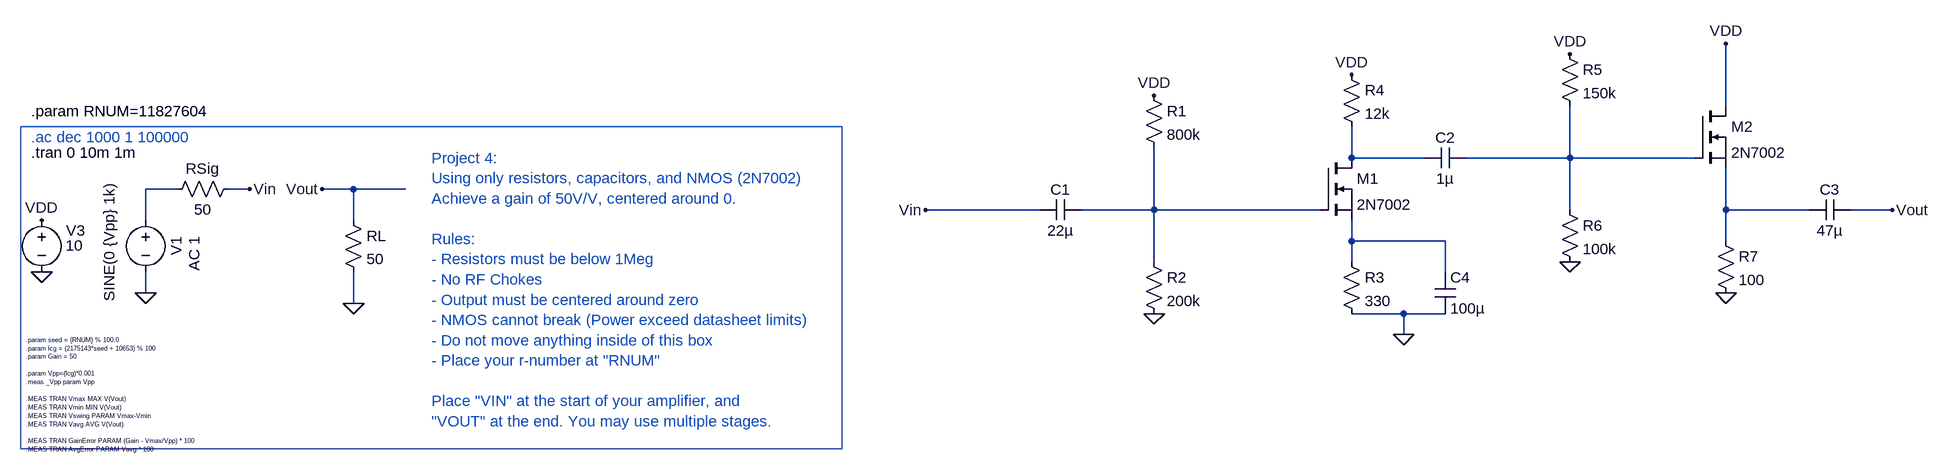
[diagram p0: schematic Project 4.asc]
Project 4.asc, the LTspice schematic file:
Version 4.1
SHEET 1 3156 680
WIRE 2048 16 2048 -80
WIRE 1472 96 1472 48
WIRE 1584 96 1472 96
WIRE 1808 96 1808 16
WIRE 1808 96 1648 96
WIRE 2000 96 1808 96
WIRE -336 144 -384 144
WIRE -224 144 -256 144
WIRE -64 144 -112 144
WIRE 16 144 -64 144
WIRE 992 176 816 176
WIRE 1168 176 1168 80
WIRE 1168 176 1056 176
WIRE 1424 176 1168 176
WIRE 1808 176 1808 96
WIRE 2048 176 2048 112
WIRE 2176 176 2048 176
WIRE 2304 176 2240 176
WIRE -384 192 -384 144
WIRE -64 192 -64 144
WIRE 1472 224 1472 192
WIRE 1616 224 1472 224
WIRE 2048 224 2048 176
WIRE 1168 256 1168 176
WIRE 1472 256 1472 224
WIRE 1616 272 1616 224
WIRE -384 304 -384 272
WIRE -64 320 -64 272
WIRE 1552 336 1472 336
WIRE 1616 336 1552 336
WIRE 1552 368 1552 336
FLAG -384 304 0
FLAG -64 320 0
FLAG -544 272 0
FLAG -544 192 VDD
FLAG -224 144 Vin
FLAG -112 144 Vout
FLAG 816 176 Vin
FLAG 1168 0 VDD
FLAG 1168 336 0
FLAG 1472 -32 VDD
FLAG 1808 256 0
FLAG 2048 304 0
FLAG 1808 -64 VDD
FLAG 2048 -80 VDD
FLAG 2304 176 Vout
FLAG 1552 368 0
SYMBOL voltage -384 176 R0
WINDOW 3 -56 -42 VRight 2
WINDOW 123 75 41 VRight 2
WINDOW 39 0 0 Left 0
WINDOW 0 47 41 VRight 2
SYMATTR Value SINE(0 {Vpp} 1k)
SYMATTR Value2 AC 1
SYMATTR InstName V1
SYMBOL res -80 176 R0
SYMATTR InstName RL
SYMATTR Value 50
SYMBOL res -240 128 R90
WINDOW 0 0 56 VBottom 2
WINDOW 3 32 56 VTop 2
SYMATTR InstName RSig
SYMATTR Value 50
SYMBOL voltage -544 176 R0
WINDOW 3 37 55 Left 2
WINDOW 123 0 0 Left 0
WINDOW 39 0 0 Left 0
WINDOW 0 38 32 Left 2
SYMATTR Value 10
SYMATTR InstName V3
SYMBOL cap 1056 160 R90
WINDOW 0 0 32 VBottom 2
WINDOW 3 32 32 VTop 2
SYMATTR InstName C1
SYMATTR Value 22µ
SYMBOL res 1152 -16 R0
SYMATTR InstName R1
SYMATTR Value 800k
SYMBOL res 1152 240 R0
SYMATTR InstName R2
SYMATTR Value 200k
SYMBOL res 1456 -48 R0
SYMATTR InstName R4
SYMATTR Value 12k
SYMBOL cap 1648 80 R90
WINDOW 0 0 32 VBottom 2
WINDOW 3 32 32 VTop 2
SYMATTR InstName C2
SYMATTR Value 1µ
SYMBOL res 1792 -80 R0
SYMATTR InstName R5
SYMATTR Value 150k
SYMBOL res 1792 160 R0
SYMATTR InstName R6
SYMATTR Value 100k
SYMBOL res 2032 208 R0
SYMATTR InstName R7
SYMATTR Value 100
SYMBOL cap 2240 160 R90
WINDOW 0 0 32 VBottom 2
WINDOW 3 32 32 VTop 2
SYMATTR InstName C3
SYMATTR Value 47µ
SYMBOL res 1456 240 R0
SYMATTR InstName R3
SYMATTR Value 330
SYMBOL nmos 1424 96 R0
SYMATTR InstName M1
SYMATTR Value 2N7002
SYMBOL nmos 2000 16 R0
SYMATTR InstName M2
SYMATTR Value 2N7002
SYMBOL cap 1600 272 R0
SYMATTR InstName C4
SYMATTR Value 100µ
TEXT -560 88 Left 2 !.tran 0 10m 1m
TEXT -560 64 Left 2 ;.ac dec 1000 1 100000
TEXT -560 24 Left 2 !.param RNUM=11827604
TEXT -568 376 Left 0 !.param seed = {RNUM} % 100.0\n.param lcg = (2175143*seed + 10653) % 100\n.param Gain = 50\n \n.param Vpp=(lcg)*0.001\n.meas _Vpp param Vpp\n \n.MEAS TRAN Vmax MAX V(Vout)\n.MEAS TRAN Vmin MIN V(Vout)\n.MEAS TRAN Vswing PARAM Vmax-Vmin\n.MEAS TRAN Vavg AVG V(Vout)\n \n.MEAS TRAN GainError PARAM (Gain - Vmax/Vpp) * 100\n.MEAS TRAN AvgError PARAM Vavg * 100
TEXT 56 96 Left 2 ;Project 4:\nUsing only resistors, capacitors, and NMOS (2N7002)\nAchieve a gain of 50V/V, centered around 0.\n \nRules:\n- Resistors must be below 1Meg\n- No RF Chokes\n- Output must be centered around zero\n- NMOS cannot break (Power exceed datasheet limits)\n- Do not move anything inside of this box\n- Place your r-number at "RNUM"\n \nPlace "VIN" at the start of your amplifier, and\n"VOUT" at the end. You may use multiple stages.
RECTANGLE Normal 688 544 -576 48

The netlist it stands for:
* Project 4.asc
V1 N003 0 SINE(0 {Vpp} 1k) AC 1
RL Vout 0 50
RSig Vin N003 50
V3 VDD 0 10
C1 N004 Vin 22µ
R1 VDD N004 800k
R2 N004 0 200k
R4 VDD N001 12k
C2 N002 N001 1µ
R5 VDD N002 150k
R6 N002 0 100k
R7 N005 0 100
C3 Vout N005 47µ
R3 N006 0 330
M1 N001 N004 N006 N006 2N7002
M2 VDD N002 N005 N005 2N7002
C4 N006 0 100µ
.model NMOS NMOS
.model PMOS PMOS
.lib standard.mos
.tran 0 10m 1m
* .ac dec 1000 1 100000
.param RNUM=11827604
.param seed = {RNUM} % 100.0
.param lcg = (2175143*seed + 10653) % 100
.param Gain = 50
.param Vpp=(lcg)*0.001
.meas _Vpp param Vpp
.MEAS TRAN Vmax MAX V(Vout)
.MEAS TRAN Vmin MIN V(Vout)
.MEAS TRAN Vswing PARAM Vmax-Vmin
.MEAS TRAN Vavg AVG V(Vout)
.MEAS TRAN GainError PARAM (Gain - Vmax/Vpp) * 100
.MEAS TRAN AvgError PARAM Vavg * 100
* Project 4:
* Using only resistors, capacitors, and NMOS (2N7002)
* Achieve a gain of 50V/V, centered around 0.
* Rules:
* - Resistors must be below 1Meg
* - No RF Chokes
* - Output must be centered around zero
* - NMOS cannot break (Power exceed datasheet limits)
* - Do not move anything inside of this box
* - Place your r-number at "RNUM"
* Place "VIN" at the start of your amplifier, and
* "VOUT" at the end. You may use multiple stages.
.backanno
.end